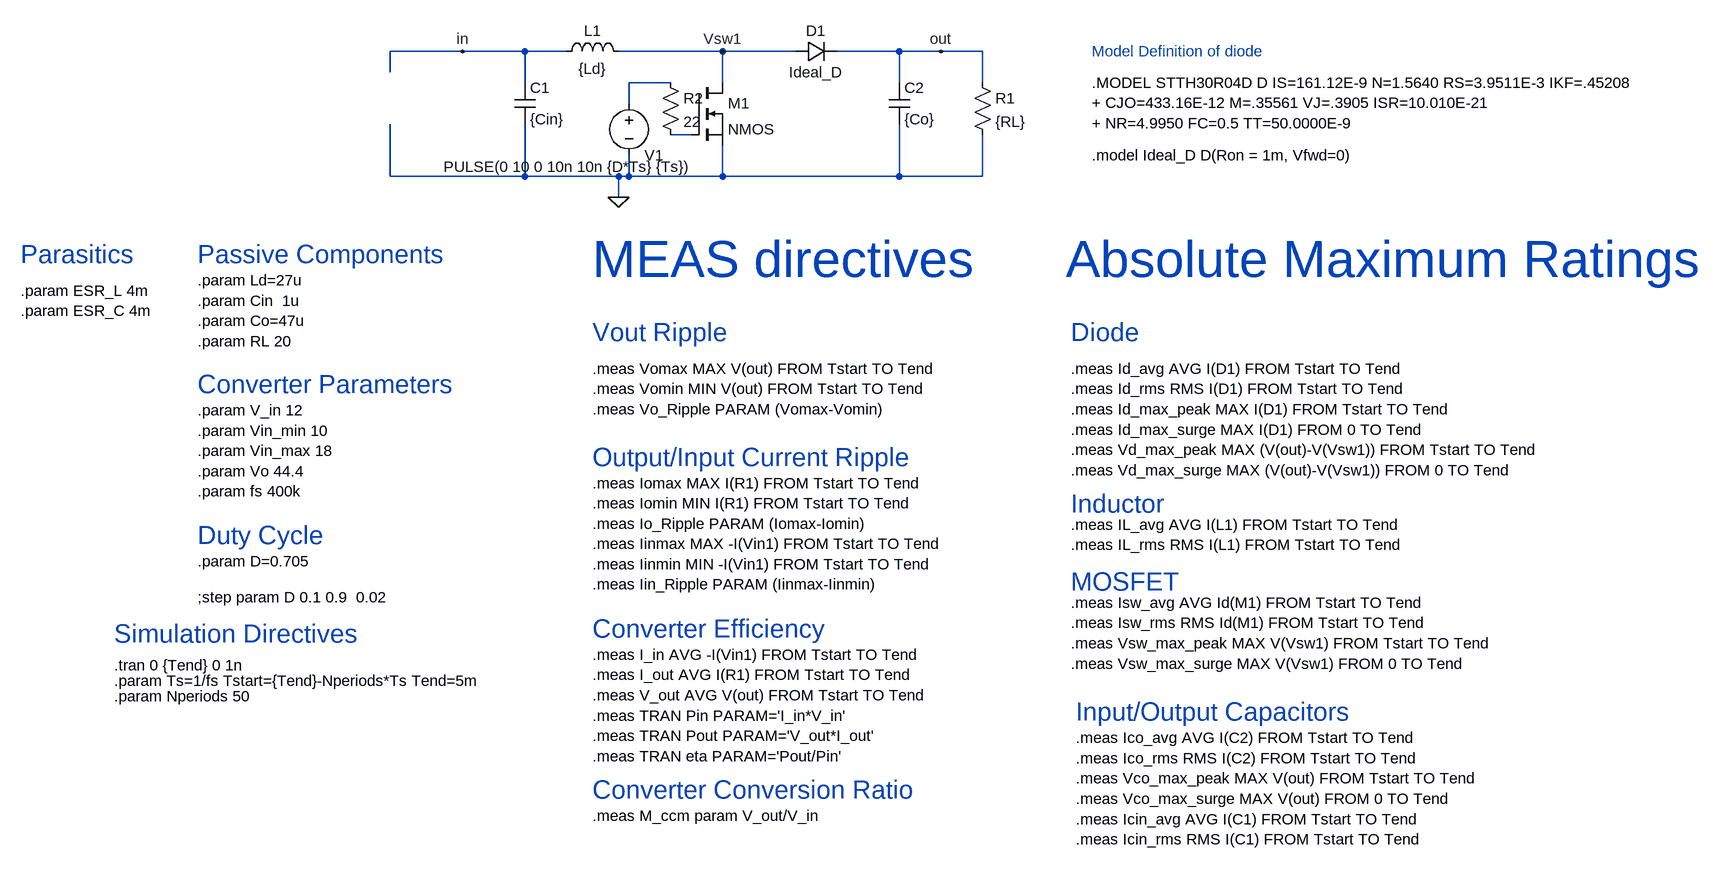
[diagram p0: schematic boost_original.asc]
boost_original.asc, the LTspice schematic file:
Version 4.1
SHEET 1 1892 1336
WIRE -96 112 -208 112
WIRE 0 112 -96 112
WIRE 64 112 0 112
WIRE 304 112 144 112
WIRE 416 112 304 112
WIRE 576 112 480 112
WIRE 640 112 576 112
WIRE 704 112 640 112
WIRE -208 144 -208 112
WIRE 0 160 0 112
WIRE 224 160 160 160
WIRE 304 160 304 112
WIRE 576 160 576 112
WIRE 704 160 704 112
WIRE 160 192 160 160
WIRE 256 240 224 240
WIRE -208 304 -208 224
WIRE 0 304 0 224
WIRE 0 304 -208 304
WIRE 144 304 0 304
WIRE 160 304 160 272
WIRE 160 304 144 304
WIRE 304 304 304 256
WIRE 304 304 160 304
WIRE 576 304 576 224
WIRE 576 304 304 304
WIRE 704 304 704 240
WIRE 704 304 576 304
WIRE 144 336 144 304
FLAG 144 336 0
FLAG 640 112 out
FLAG -96 112 in
FLAG 304 112 Vsw1
SYMBOL cap -16 160 R0
SYMATTR InstName C1
SYMATTR Value {Cin}
SYMATTR SpiceLine Rser={ESR_C}
SYMBOL cap 560 160 R0
SYMATTR InstName C2
SYMATTR Value {Co}
SYMATTR SpiceLine Rser={ESR_C}
SYMBOL res 688 144 R0
SYMATTR InstName R1
SYMATTR Value {RL}
SYMBOL ind 48 128 R270
WINDOW 0 32 56 VTop 2
WINDOW 3 5 56 VBottom 2
SYMATTR InstName L1
SYMATTR Value {Ld}
SYMATTR SpiceLine Rser={ESR_L}
SYMBOL diode 416 128 R270
WINDOW 0 32 32 VTop 2
WINDOW 3 0 32 VBottom 2
SYMATTR InstName D1
SYMATTR Value Ideal_D
SYMBOL voltage 160 176 R0
WINDOW 0 24 96 Left 2
WINDOW 3 -285 113 Left 2
WINDOW 123 0 0 Left 0
WINDOW 39 0 0 Left 0
SYMATTR InstName V1
SYMATTR Value PULSE(0 10 0 10n 10n {D*Ts} {Ts})
SYMBOL res 208 144 R0
SYMATTR InstName R2
SYMATTR Value 22
SYMBOL nmos 256 160 R0
SYMATTR InstName M1
TEXT -504 464 Left 2 !.param Ld=27u\n.param Cin  1u\n.param Co=47u\n.param RL 20
TEXT -632 1056 Left 2 !.tran 0 {Tend} 0 1n
TEXT -504 896 Left 2 !.param D=0.705
TEXT -632 1080 Left 2 !.param Ts=1/fs Tstart={Tend}-Nperiods*Ts Tend=5m
TEXT 872 160 Left 2 !.MODEL STTH30R04D D IS=161.12E-9 N=1.5640 RS=3.9511E-3 IKF=.45208\n+ CJO=433.16E-12 M=.35561 VJ=.3905 ISR=10.010E-21\n+ NR=4.9950 FC=0.5 TT=50.0000E-9
TEXT 872 112 Left 2 ;Model Definition of diode
TEXT -504 952 Left 2 !;step param D 0.1 0.9  0.02
TEXT -504 664 Left 2 !.param V_in 12\n.param Vin_min 10\n.param Vin_max 18\n.param Vo 44.4\n.param fs 400k
TEXT -504 424 Left 4 ;Passive Components
TEXT -504 624 Left 4 ;Converter Parameters
TEXT 840 600 Left 2 !.meas Id_avg AVG I(D1) FROM Tstart TO Tend\n.meas Id_rms RMS I(D1) FROM Tstart TO Tend\n.meas Id_max_peak MAX I(D1) FROM Tstart TO Tend\n.meas Id_max_surge MAX I(D1) FROM 0 TO Tend\n.meas Vd_max_peak MAX (V(out)-V(Vsw1)) FROM Tstart TO Tend\n.meas Vd_max_surge MAX (V(out)-V(Vsw1)) FROM 0 TO Tend
TEXT 832 432 Left 6 ;Absolute Maximum Ratings
TEXT 840 544 Left 4 ;Diode
TEXT 840 840 Left 2 !.meas IL_avg AVG I(L1) FROM Tstart TO Tend\n.meas IL_rms RMS I(L1) FROM Tstart TO Tend
TEXT 840 808 Left 4 ;Inductor
TEXT 840 960 Left 2 !.meas Isw_avg AVG Id(M1) FROM Tstart TO Tend\n.meas Isw_rms RMS Id(M1) FROM Tstart TO Tend\n.meas Vsw_max_peak MAX V(Vsw1) FROM Tstart TO Tend\n.meas Vsw_max_surge MAX V(Vsw1) FROM 0 TO Tend
TEXT 840 928 Left 4 ;MOSFET
TEXT 848 1168 Left 2 !.meas Ico_avg AVG I(C2) FROM Tstart TO Tend\n.meas Ico_rms RMS I(C2) FROM Tstart TO Tend\n.meas Vco_max_peak MAX V(out) FROM Tstart TO Tend\n.meas Vco_max_surge MAX V(out) FROM 0 TO Tend\n.meas Icin_avg AVG I(C1) FROM Tstart TO Tend\n.meas Icin_rms RMS I(C1) FROM Tstart TO Tend
TEXT 848 1128 Left 4 ;Input/Output Capacitors
TEXT -504 856 Left 4 ;Duty Cycle
TEXT 104 432 Left 6 ;MEAS directives
TEXT 104 544 Left 4 ;Vout Ripple
TEXT 104 600 Left 2 !.meas Vomax MAX V(out) FROM Tstart TO Tend\n.meas Vomin MIN V(out) FROM Tstart TO Tend\n.meas Vo_Ripple PARAM (Vomax-Vomin)
TEXT 104 736 Left 4 ;Output/Input Current Ripple
TEXT 104 776 Left 2 !.meas Iomax MAX I(R1) FROM Tstart TO Tend\n.meas Iomin MIN I(R1) FROM Tstart TO Tend\n.meas Io_Ripple PARAM (Iomax-Iomin)\n.meas Iinmax MAX -I(Vin1) FROM Tstart TO Tend\n.meas Iinmin MIN -I(Vin1) FROM Tstart TO Tend\n.meas Iin_Ripple PARAM (Iinmax-Iinmin)
TEXT 104 1040 Left 2 !.meas I_in AVG -I(Vin1) FROM Tstart TO Tend\n.meas I_out AVG I(R1) FROM Tstart TO Tend\n.meas V_out AVG V(out) FROM Tstart TO Tend\n.meas TRAN Pin PARAM='I_in*V_in'\n.meas TRAN Pout PARAM='V_out*I_out'\n.meas TRAN eta PARAM='Pout/Pin'
TEXT 104 1000 Left 4 ;Converter Efficiency
TEXT 104 1248 Left 4 ;Converter Conversion Ratio
TEXT 104 1288 Left 2 !.meas M_ccm param V_out/V_in
TEXT -632 1008 Left 4 ;Simulation Directives
TEXT -776 424 Left 4 ;Parasitics
TEXT -776 480 Left 2 !.param ESR_L 4m\n.param ESR_C 4m
TEXT -632 1104 Left 2 !.param Nperiods 50
TEXT 872 272 Left 2 !.model Ideal_D D(Ron = 1m, Vfwd=0)

The netlist it stands for:
* boost_original.asc
C1 in 0 {Cin} Rser={ESR_C}
C2 out 0 {Co} Rser={ESR_C}
R1 out 0 {RL}
L1 in Vsw1 {Ld} Rser={ESR_L}
D1 Vsw1 out Ideal_D
V1 N001 0 PULSE(0 10 0 10n 10n {D*Ts} {Ts})
R2 N001 N002 22
M1 Vsw1 N002 0 0 NMOS
.model D D
.lib standard.dio
.model NMOS NMOS
.model PMOS PMOS
.lib standard.mos
.param Ld=27u
.param Cin  1u
.param Co=47u
.param RL 20
.tran 0 {Tend} 0 1n
.param D=0.705
.param Ts=1/fs Tstart={Tend}-Nperiods*Ts Tend=5m
.MODEL STTH30R04D D IS=161.12E-9 N=1.5640 RS=3.9511E-3 IKF=.45208
+ CJO=433.16E-12 M=.35561 VJ=.3905 ISR=10.010E-21
+ NR=4.9950 FC=0.5 TT=50.0000E-9
* Model Definition of diode
;step param D 0.1 0.9  0.02
.param V_in 12
.param Vin_min 10
.param Vin_max 18
.param Vo 44.4
.param fs 400k
* Passive Components
* Converter Parameters
.meas Id_avg AVG I(D1) FROM Tstart TO Tend
.meas Id_rms RMS I(D1) FROM Tstart TO Tend
.meas Id_max_peak MAX I(D1) FROM Tstart TO Tend
.meas Id_max_surge MAX I(D1) FROM 0 TO Tend
.meas Vd_max_peak MAX (V(out)-V(Vsw1)) FROM Tstart TO Tend
.meas Vd_max_surge MAX (V(out)-V(Vsw1)) FROM 0 TO Tend
* Absolute Maximum Ratings
* Diode
.meas IL_avg AVG I(L1) FROM Tstart TO Tend
.meas IL_rms RMS I(L1) FROM Tstart TO Tend
* Inductor
.meas Isw_avg AVG Id(M1) FROM Tstart TO Tend
.meas Isw_rms RMS Id(M1) FROM Tstart TO Tend
.meas Vsw_max_peak MAX V(Vsw1) FROM Tstart TO Tend
.meas Vsw_max_surge MAX V(Vsw1) FROM 0 TO Tend
* MOSFET
.meas Ico_avg AVG I(C2) FROM Tstart TO Tend
.meas Ico_rms RMS I(C2) FROM Tstart TO Tend
.meas Vco_max_peak MAX V(out) FROM Tstart TO Tend
.meas Vco_max_surge MAX V(out) FROM 0 TO Tend
.meas Icin_avg AVG I(C1) FROM Tstart TO Tend
.meas Icin_rms RMS I(C1) FROM Tstart TO Tend
* Input/Output Capacitors
* Duty Cycle
* MEAS directives
* Vout Ripple
.meas Vomax MAX V(out) FROM Tstart TO Tend
.meas Vomin MIN V(out) FROM Tstart TO Tend
.meas Vo_Ripple PARAM (Vomax-Vomin)
* Output/Input Current Ripple
.meas Iomax MAX I(R1) FROM Tstart TO Tend
.meas Iomin MIN I(R1) FROM Tstart TO Tend
.meas Io_Ripple PARAM (Iomax-Iomin)
.meas Iinmax MAX -I(Vin1) FROM Tstart TO Tend
.meas Iinmin MIN -I(Vin1) FROM Tstart TO Tend
.meas Iin_Ripple PARAM (Iinmax-Iinmin)
.meas I_in AVG -I(Vin1) FROM Tstart TO Tend
.meas I_out AVG I(R1) FROM Tstart TO Tend
.meas V_out AVG V(out) FROM Tstart TO Tend
.meas TRAN Pin PARAM='I_in*V_in'
.meas TRAN Pout PARAM='V_out*I_out'
.meas TRAN eta PARAM='Pout/Pin'
* Converter Efficiency
* Converter Conversion Ratio
.meas M_ccm param V_out/V_in
* Simulation Directives
* Parasitics
.param ESR_L 4m
.param ESR_C 4m
.param Nperiods 50
.model Ideal_D D(Ron = 1m, Vfwd=0)
.backanno
.end